# Altium schematic sheet CAN_TRANSCEIVER.SchDoc
size A; SheetNumber: 4; SheetTotal: 7
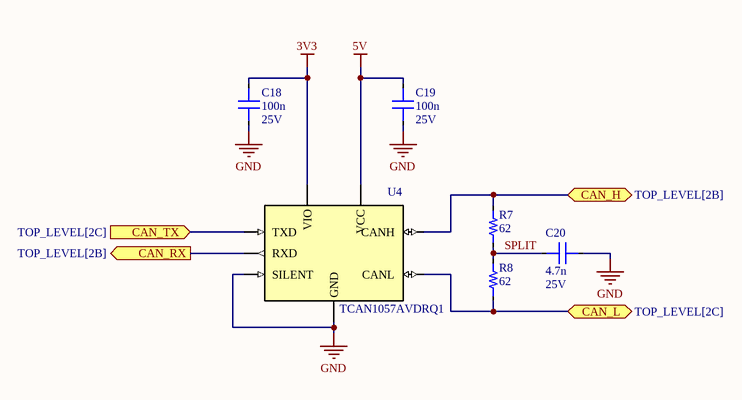
[diagram p0: CAN_TRANSCEIVER.SchDoc]

## Parts
C18  value 100n  Voltage: 25V  [0603_CAP]  (hidden comment: Capacitor)
C19  value 100n  Voltage: 25V  [0603_CAP]  (hidden comment: Capacitor)
C20  value 4.7n  Voltage: 25V  [0603_CAP]  (hidden comment: Capacitor)
R7  value 62  [0603_RES]  (hidden comment: Resistor)
R8  value 62  [0603_RES]  (hidden comment: Resistor)
U4  TCAN1057AVDRQ1  [SOIC8_D_TEX]

## Ports
CAN_H (bidir, see TOP_LEVEL[2B]), CAN_L (bidir, see TOP_LEVEL[2C]), CAN_RX (out, see TOP_LEVEL[2B]), CAN_TX (in, see TOP_LEVEL[2C])

## Nets
3V3: C18.2 U4.5(VIO)
5V: C19.2 U4.3(VCC)
GND: C18.1 C19.1 C20.2 U4.2(GND) U4.8(SILENT)
CAN_H: R7.2 U4.7(CANH) ; port CAN_H
CAN_L: R8.1 U4.6(CANL) ; port CAN_L
CAN_RX: U4.4(RXD) ; port CAN_RX
CAN_TX: U4.1(TXD) ; port CAN_TX
SPLIT: C20.1 R7.1 R8.2

## Library data of the parts
U4 = TCAN1057AVDRQ1: CAN transceiver with silent mode 8-SOIC Bus Protected; Manufacturer_Name: Texas Instruments; Type: Interface; Copyright: Copyright (C) 2025 Ultra Librarian. All rights reserved.; Manufacturer_Part_Number: TCAN1057AVDRQ1; RefDes: RefDes; ComponentLink1Description: Datasheet; ComponentLink1URL: https://www.ti.com/lit/ds/symlink/tcan1057a-q1.pdf
C18-C20 = Capacitor: Dielectric: *; Percent Tolerance: *; ESR: *
R7 R8 = Resistor: Tolerance: *